# Altium project SydorenkoG12.PrjPcb
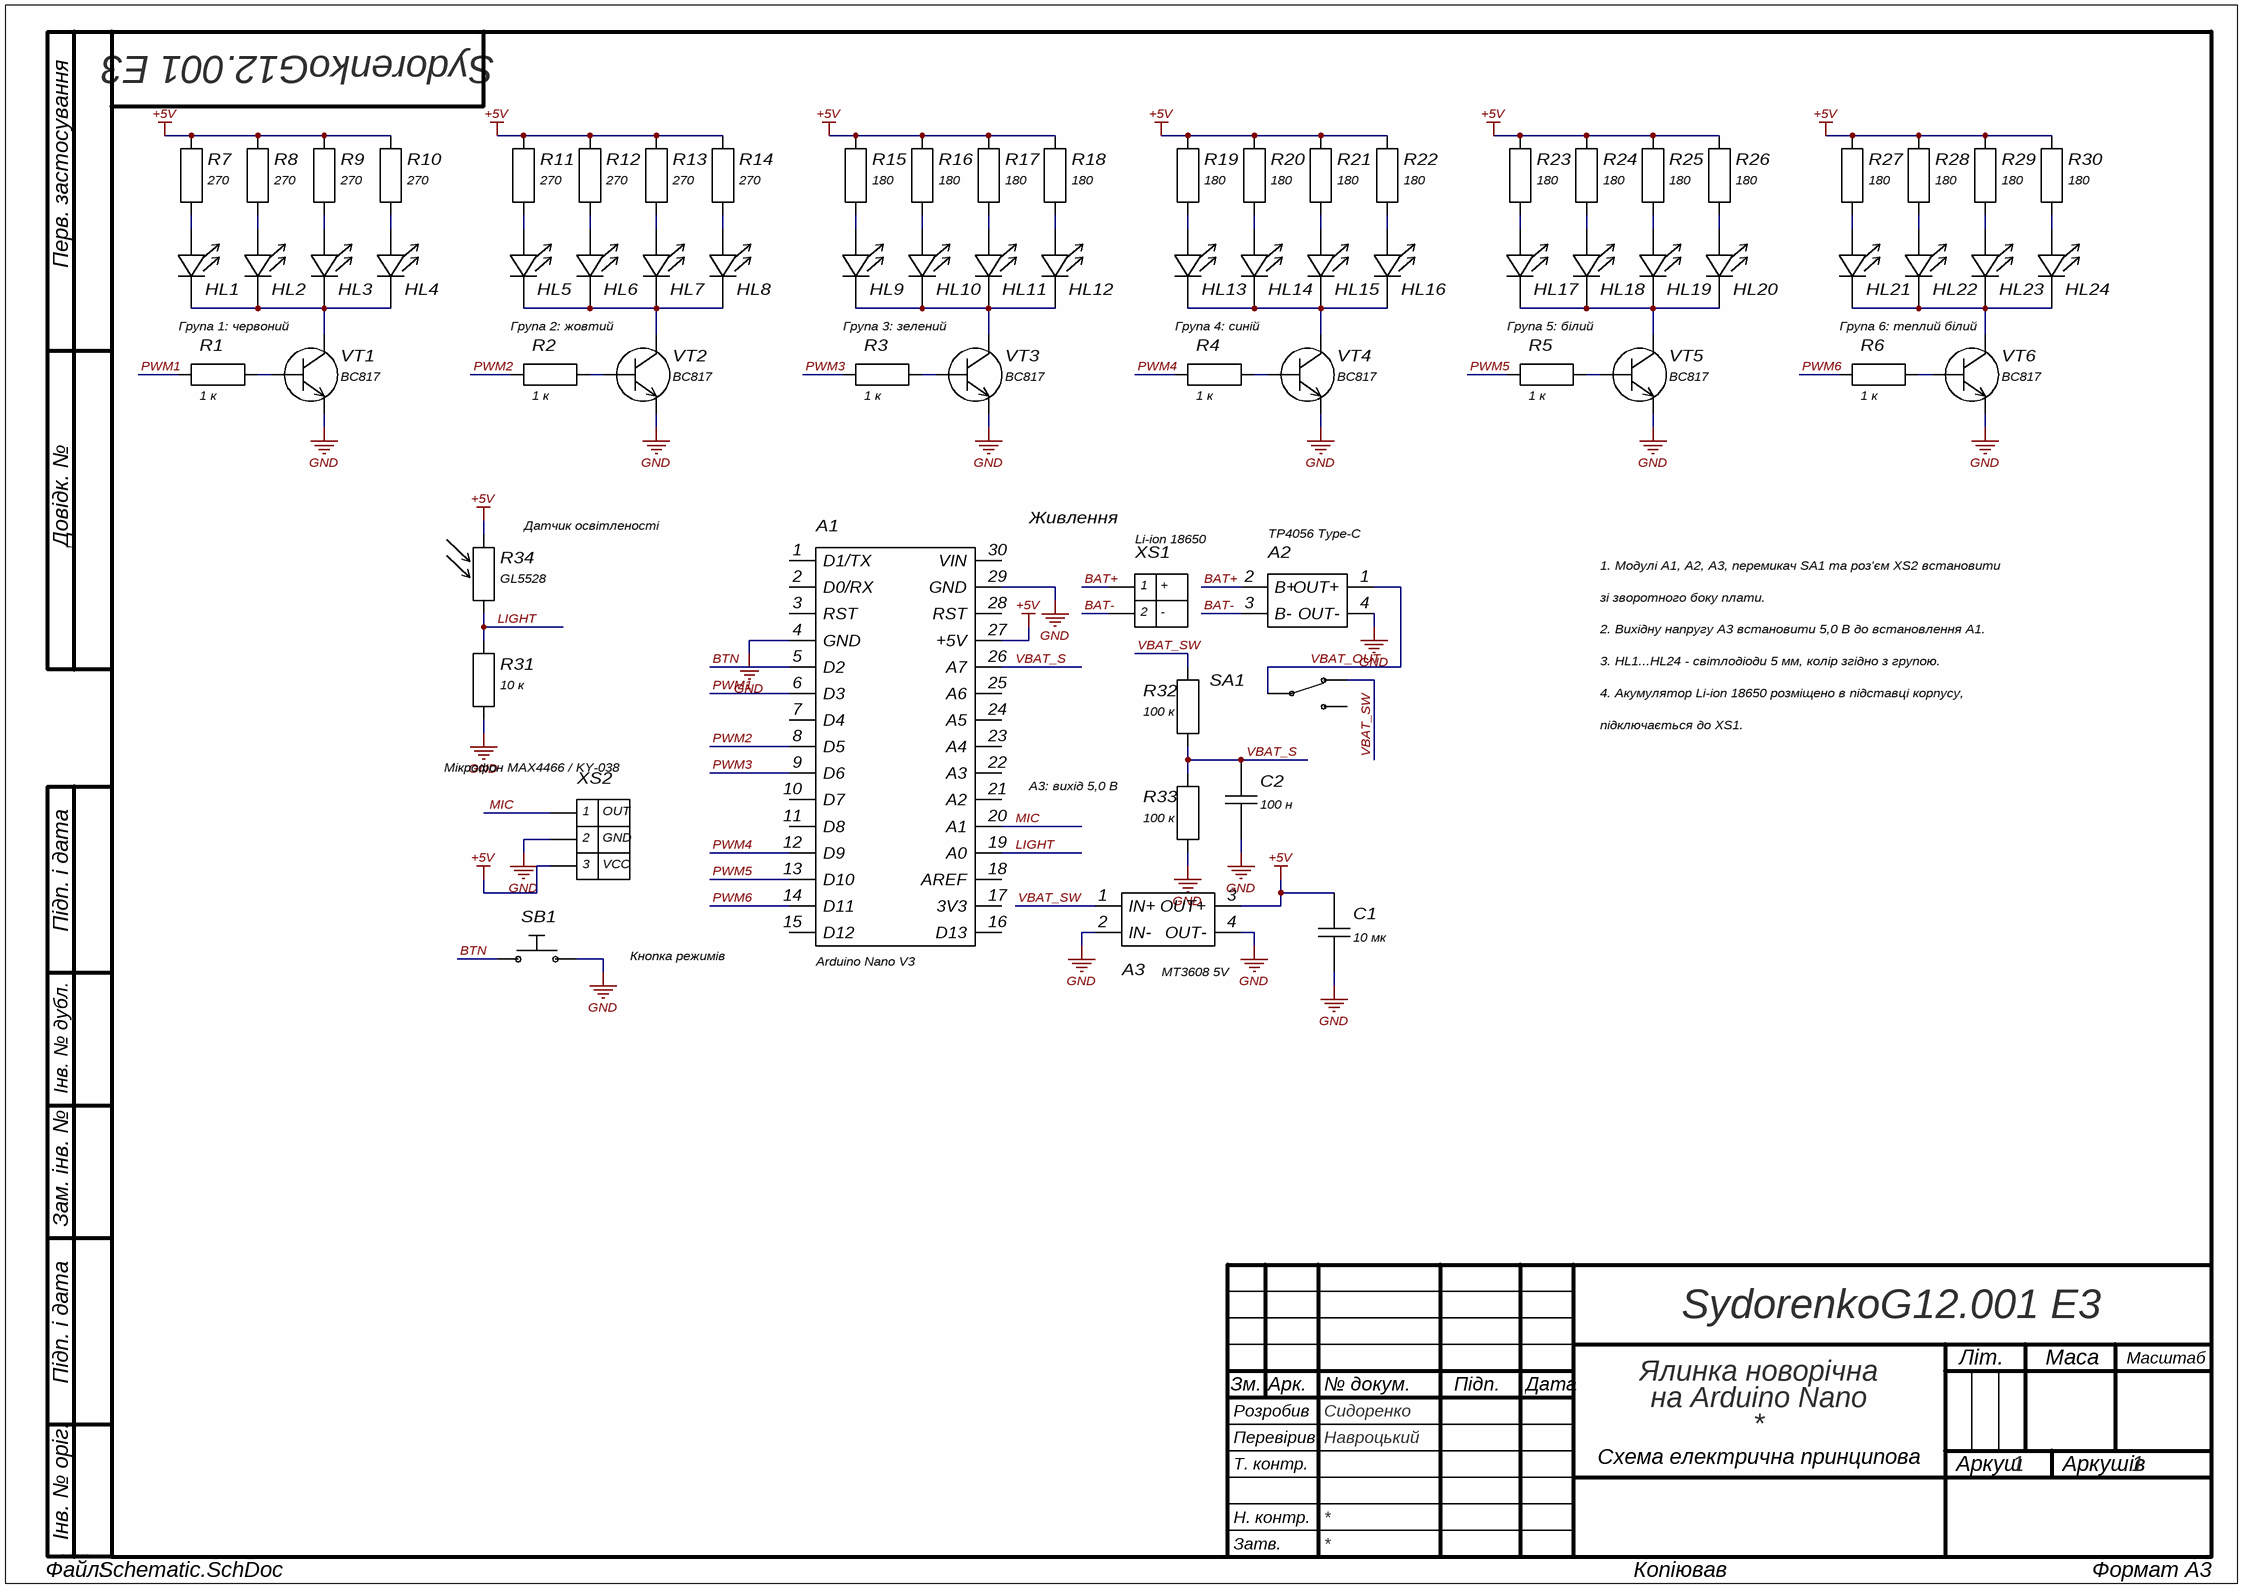
[diagram p0: Schematic.SchDoc]
1 sheet, 73 parts. Net scope: global (net labels, ports and power ports of the same name join across sheets).
Board file: SydorenkoG12.PcbDoc

## Sheet Schematic.SchDoc: Ялинка новорічна на Arduino Nano
size 419 x 297 mm; Author: Сидоренко; Engineer: Навроцький; DocumentNumber: SydorenkoG12.001 Е3; SheetNumber: 1; SheetTotal: 1; Наименование1: Ялинка новорічна; Наименование2: на Arduino Nano; ProjectName: SydorenkoG12

### Parts
A1  Arduino Nano V3  [ARDUINO_NANO]
A2  TP4056 Type-C  [MOD_TP4056]
A3  MT3608 5V  [MOD_MT3608]
C1  10 мк  [C_0805]
C2  100 н  [C_0805]
HL1  LED 5mm  [LED_5MM]  (value not drawn)
HL2  LED 5mm  [LED_5MM]  (value not drawn)
HL3  LED 5mm  [LED_5MM]  (value not drawn)
HL4  LED 5mm  [LED_5MM]  (value not drawn)
HL5  LED 5mm  [LED_5MM]  (value not drawn)
HL6  LED 5mm  [LED_5MM]  (value not drawn)
HL7  LED 5mm  [LED_5MM]  (value not drawn)
HL8  LED 5mm  [LED_5MM]  (value not drawn)
HL9  LED 5mm  [LED_5MM]  (value not drawn)
HL10  LED 5mm  [LED_5MM]  (value not drawn)
HL11  LED 5mm  [LED_5MM]  (value not drawn)
HL12  LED 5mm  [LED_5MM]  (value not drawn)
HL13  LED 5mm  [LED_5MM]  (value not drawn)
HL14  LED 5mm  [LED_5MM]  (value not drawn)
HL15  LED 5mm  [LED_5MM]  (value not drawn)
HL16  LED 5mm  [LED_5MM]  (value not drawn)
HL17  LED 5mm  [LED_5MM]  (value not drawn)
HL18  LED 5mm  [LED_5MM]  (value not drawn)
HL19  LED 5mm  [LED_5MM]  (value not drawn)
HL20  LED 5mm  [LED_5MM]  (value not drawn)
HL21  LED 5mm  [LED_5MM]  (value not drawn)
HL22  LED 5mm  [LED_5MM]  (value not drawn)
HL23  LED 5mm  [LED_5MM]  (value not drawn)
HL24  LED 5mm  [LED_5MM]  (value not drawn)
R1  1 к  [R_0805]
R2  1 к  [R_0805]
R3  1 к  [R_0805]
R4  1 к  [R_0805]
R5  1 к  [R_0805]
R6  1 к  [R_0805]
R7  270  [R_0805]
R8  270  [R_0805]
R9  270  [R_0805]
R10  270  [R_0805]
R11  270  [R_0805]
R12  270  [R_0805]
R13  270  [R_0805]
R14  270  [R_0805]
R15  180  [R_0805]
R16  180  [R_0805]
R17  180  [R_0805]
R18  180  [R_0805]
R19  180  [R_0805]
R20  180  [R_0805]
R21  180  [R_0805]
R22  180  [R_0805]
R23  180  [R_0805]
R24  180  [R_0805]
R25  180  [R_0805]
R26  180  [R_0805]
R27  180  [R_0805]
R28  180  [R_0805]
R29  180  [R_0805]
R30  180  [R_0805]
R31  10 к  [R_0805]
R32  100 к  [R_0805]
R33  100 к  [R_0805]
R34  GL5528  [LDR_5MM]
SA1  SS12D00  [SW_SLIDE_SPDT]  (value not drawn)
SB1  TS-6x6  [TACT_6X6]  (value not drawn)
VT1  BC817  [SOT-23]
VT2  BC817  [SOT-23]
VT3  BC817  [SOT-23]
VT4  BC817  [SOT-23]
VT5  BC817  [SOT-23]
VT6  BC817  [SOT-23]
XS1  Li-ion 18650  [BAT_PADS_2]
XS2  MAX4466 / KY-038  [PINHDR_1X3]  (value not drawn)

### Nets
+5V: A1.27(+5V) A3.3(OUT+) C1.1 R7.1 R8.1 R9.1 R10.1 R11.1 R12.1 R13.1 R14.1 R15.1 R16.1 R17.1 R18.1 R19.1 R20.1 R21.1 R22.1 R23.1 R24.1 R25.1 R26.1 R27.1 R28.1 R29.1 R30.1 R34.1 XS2.3(VCC)
GND: A1.4(GND) A1.29(GND) A2.4(OUT-) A3.2(IN-) A3.4(OUT-) C1.2 C2.2 R31.2 R33.2 SB1.2 VT1.2(E) VT2.2(E) VT3.2(E) VT4.2(E) VT5.2(E) VT6.2(E) XS2.2(GND)
BAT+: A2.2(B+) XS1.1(+)
BAT-: A2.3(B-) XS1.2(-)
BTN: A1.5(D2) SB1.1
LIGHT: A1.19(A0) R31.1 R34.2
MIC: A1.20(A1) XS2.1(OUT)
PWM1: A1.6(D3) R1.1
PWM2: A1.8(D5) R2.1
PWM3: A1.9(D6) R3.1
PWM4: A1.12(D9) R4.1
PWM5: A1.13(D10) R5.1
PWM6: A1.14(D11) R6.1
VBAT_OUT: A2.1(OUT+) SA1.2
VBAT_S: A1.26(A7) C2.1 R32.2 R33.1
VBAT_SW: A3.1(IN+) R32.1 SA1.1
NetHL1_1: HL1.1(K) HL2.1(K) HL3.1(K) HL4.1(K) VT1.3(C)
NetHL1_2: HL1.2(A) R7.2
NetHL2_2: HL2.2(A) R8.2
NetHL3_2: HL3.2(A) R9.2
NetHL4_2: HL4.2(A) R10.2
NetHL5_1: HL5.1(K) HL6.1(K) HL7.1(K) HL8.1(K) VT2.3(C)
NetHL5_2: HL5.2(A) R11.2
NetHL6_2: HL6.2(A) R12.2
NetHL7_2: HL7.2(A) R13.2
NetHL8_2: HL8.2(A) R14.2
NetHL9_1: HL9.1(K) HL10.1(K) HL11.1(K) HL12.1(K) VT3.3(C)
NetHL9_2: HL9.2(A) R15.2
NetHL10_2: HL10.2(A) R16.2
NetHL11_2: HL11.2(A) R17.2
NetHL12_2: HL12.2(A) R18.2
NetHL13_1: HL13.1(K) HL14.1(K) HL15.1(K) HL16.1(K) VT4.3(C)
NetHL13_2: HL13.2(A) R19.2
NetHL14_2: HL14.2(A) R20.2
NetHL15_2: HL15.2(A) R21.2
NetHL16_2: HL16.2(A) R22.2
NetHL17_1: HL17.1(K) HL18.1(K) HL19.1(K) HL20.1(K) VT5.3(C)
NetHL17_2: HL17.2(A) R23.2
NetHL18_2: HL18.2(A) R24.2
NetHL19_2: HL19.2(A) R25.2
NetHL20_2: HL20.2(A) R26.2
NetHL21_1: HL21.1(K) HL22.1(K) HL23.1(K) HL24.1(K) VT6.3(C)
NetHL21_2: HL21.2(A) R27.2
NetHL22_2: HL22.2(A) R28.2
NetHL23_2: HL23.2(A) R29.2
NetHL24_2: HL24.2(A) R30.2
NetR1_2: R1.2 VT1.1(B)
NetR2_2: R2.2 VT2.1(B)
NetR3_2: R3.2 VT3.1(B)
NetR4_2: R4.2 VT4.1(B)
NetR5_2: R5.2 VT5.1(B)
NetR6_2: R6.2 VT6.1(B)

Not connected (* = marked no-connect by the designer): A1 1(D1/TX) 2(D0/RX) 3(RST) 7(D4) 10(D7) 11(D8) 15(D12) 16(D13) 17(3V3) 18(AREF) 21(A2) 22(A3) 23(A4) 24(A5) 25(A6) 28(RST) 30(VIN); SA1 3

### Notes on the sheet
- Перв. застосування
- (near VT1) Група 1: червоний
- (near VT2) Група 2: жовтий
- (near VT3) Група 3: зелений
- Група 4: синій
- Група 5: білий
- (near VT6) Група 6: теплий білий
- (near R34) Датчик освітленості
- Живлення
- Довідк. №
- 1. Модулі A1, A2, A3, перемикач SA1 та роз'єм XS2 встановити
- зі зворотного боку плати.
- 2. Вихідну напругу A3 встановити 5,0 В до встановлення A1.
- 3. HL1...HL24 - світлодіоди 5 мм, колір згідно з групою.
- 4. Акумулятор Li-ion 18650 розміщено в підставці корпусу,
- підключається до XS1.
- Мікрофон MAX4466 / KY-038
- A3: вихід 5,0 В
- Підп. і дата
- Кнопка режимів
- Інв. № дубл.
- Зам. інв. №
- Зм.
- Розробив
- Арк.
- № докум.
- Підп.
- Дата
- Літ.
- Маса
- Масштаб
- Перевірив
- Т. контр.
- Схема електрична принципова
- Аркуш
- Аркушів
- Інв. № оріг.
- Н. контр.
- Затв.
- Файл:
- ALTIUM GOSTBOM2.0 KEV
- Копіював
- Формат А3

### Library data of the parts
A1 = Arduino Nano: Модуль мікроконтролера Arduino Nano V3 (ATmega328P, 16 МГц)
A2 = TP4056 module: Модуль заряду Li-ion TP4056 з USB Type-C та захистом DW01
A3 = MT3608 module: Підвищувальний DC-DC модуль MT3608, вихід налаштувати на 5,0 В
C1 = C_0805: Конденсатор 0805 10 мкФ 16 В X5R
C2 = C_0805: Конденсатор 0805 100 нФ 50 В X7R
HL1-HL4 = LED: Світлодіод 5 мм, червоний
HL5-HL8 = LED: Світлодіод 5 мм, жовтий
HL9-HL12 = LED: Світлодіод 5 мм, зелений
HL13-HL16 = LED: Світлодіод 5 мм, синій
HL17-HL20 = LED: Світлодіод 5 мм, білий
HL21-HL24 = LED: Світлодіод 5 мм, теплий білий
R1-R6 = R_0805: Резистор 0805 1 кОм 5%
R7-R14 = R_0805: Резистор 0805 270 Ом 5%
R15-R30 = R_0805: Резистор 0805 180 Ом 5%
R31 = R_0805: Резистор 0805 10 кОм 5%
R32 R33 = R_0805: Резистор 0805 100 кОм 1%
R34 = Photoresistor: Фоторезистор GL5528
SA1 = Switch SPDT: Перемикач живлення SS12D00
SB1 = Button: Кнопка тактова 6x6 мм (режими)
VT1-VT6 = VT npn SOT23: Транзистор NPN BC817-40, SOT-23
XS1 = Battery pads: Контакти для акумулятора 18650 (тримач на дротах)
XS2 = Mic header: Роз'єм модуля мікрофона (OUT, GND, VCC)